# Altium schematic sheet RK3566_FLASH-SD_SHEET.SchDoc
size A4; SheetNumber: 11; SheetTotal: 23
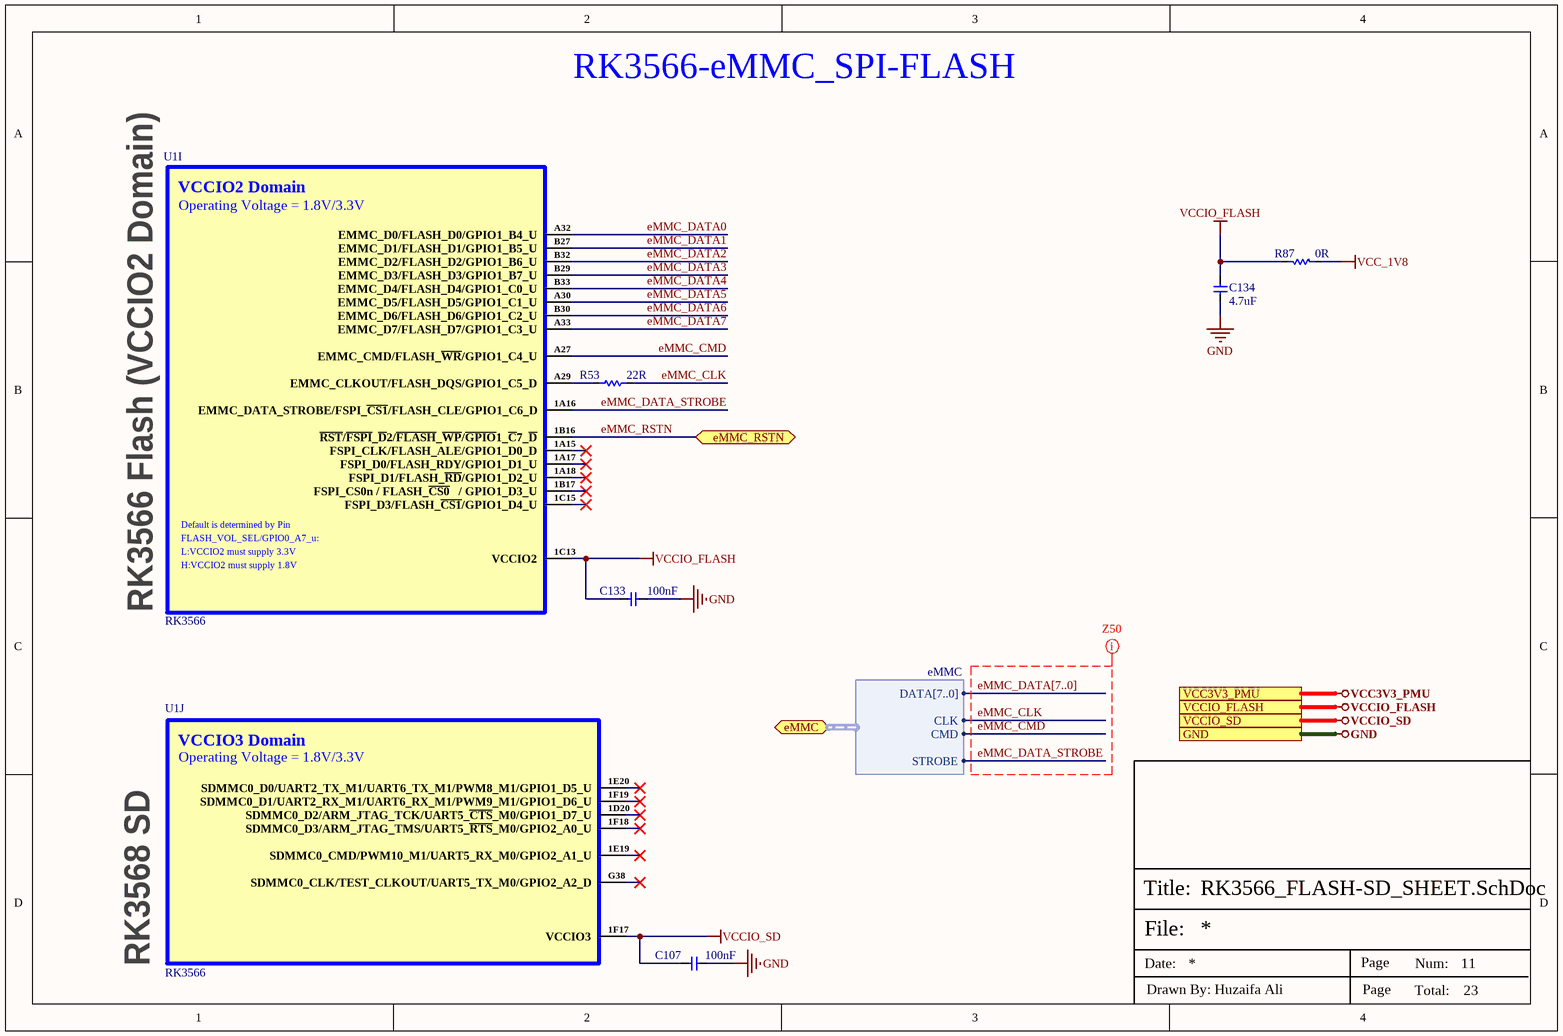
[diagram p0: RK3566_FLASH-SD_SHEET.SchDoc]

## Parts
C107  100nF  [CAP-0201]
C133  100nF  [CAP-0201]
C134  4.7uF  [Cap-0402]
R53  22R  [Res-0402]
R87  0R  [Res-0402]
U1  RK3566  [BGA-565(15.5x14.4)]  (parts I,J of 22)

## Ports
eMMC (bidir, harness eMMC, see eMMC_SPI-FLASH_SHEET[2D]), eMMC_RSTN (bidir, see eMMC_SPI-FLASH_SHEET[1D]), GND (see DRAM_LPDDR4_SHEET[6D], eMMC_SPI-FLASH_SHEET[1D], HDMI2.0_SHEET[3D], POWER_LDO_SHEET[3D], POWER_OTHER_SHEET[3C], POWER_PMIC_RK809_CODEC[3C], POWER_PMIC_RK809_DC DC[3D], POWER_PMIC_RK809_LDO[4C], POWER_PMIC_RK809_MGM[3D], RK3566_AUDIO_SHEET[3C], RK3566_DDR-PHY_SHEET[5D], RK3566_OSC_PMUIO_SHEET[5D], RK3566_POWER_SHEET[3D], RK3566_SARADC_GPIO[3D], RK3566_USB_PCIe_SHEET[3D], RK3566_VI_SHEET[3D], RK3566_VO_SHEET_1[3C], RK3566_VO_SHEET_2[4C], TYPE-C_INTERFACE_SHEET[3D], TYPE-C_TO_MIPI-CSI_SHEET[5D], USB2.0_SHEET[3D], WIFI-6_SHEET[3D]), VCC3V3_PMU (see POWER_OTHER_SHEET[3C], POWER_PMIC_RK809_LDO[4C], RK3566_OSC_PMUIO_SHEET[5D]), VCCIO_FLASH (see eMMC_SPI-FLASH_SHEET[1D]), VCCIO_SD (see POWER_PMIC_RK809_LDO[4C])

## Harnesses
eMMC: DATA[7..0], STROBE, CLK, CMD

## Nets
GND: C107.1 C133.1 C134.1 ; port GND
VCC3V3_PMU: port VCC3V3_PMU
VCC_1V8: R87.1
VCCIO_FLASH: C133.2 C134.2 R87.2 U1.1C13(VCCIO2) ; port VCCIO_FLASH
VCCIO_SD: C107.2 U1.1F17(VCCIO3) ; port VCCIO_SD
eMMC_CLK: R53.1 ; port eMMC.CLK
eMMC_CMD: U1.A27(EMMC_CMD/FLASH_~{WR}/GPIO1_C4_U) ; port eMMC.CMD
eMMC_DATA0: U1.A32(EMMC_D0/FLASH_D0/GPIO1_B4_U)
eMMC_DATA1: U1.B27(EMMC_D1/FLASH_D1/GPIO1_B5_U)
eMMC_DATA2: U1.B32(EMMC_D2/FLASH_D2/GPIO1_B6_U)
eMMC_DATA3: U1.B29(EMMC_D3/FLASH_D3/GPIO1_B7_U)
eMMC_DATA4: U1.B33(EMMC_D4/FLASH_D4/GPIO1_C0_U)
eMMC_DATA5: U1.A30(EMMC_D5/FLASH_D5/GPIO1_C1_U)
eMMC_DATA6: U1.B30(EMMC_D6/FLASH_D6/GPIO1_C2_U)
eMMC_DATA7: U1.A33(EMMC_D7/FLASH_D7/GPIO1_C3_U)
eMMC_DATA_STROBE: U1.1A16(EMMC_DATA_STROBE/FSPI_~{CS1}/FLASH_CLE/GPIO1_C6_D) ; port eMMC.STROBE
eMMC_RSTN: U1.1B16(~{RST}/~{FSPI}_~{D}2/~{FLASH}_~{WP}/~{GPIO}1_~{C}7_~{D}) ; port eMMC_RSTN
NetR53_2: R53.2 U1.A29(EMMC_CLKOUT/FLASH_DQS/GPIO1_C5_D)

Not connected (* = marked no-connect by the designer): U1 1A15(FSPI_CLK/FLASH_ALE/GPIO1_D0_D)* 1A17(FSPI_D0/FLASH_RDY/GPIO1_D1_U)* 1A18(FSPI_D1/FLASH_~{RD}/GPIO1_D2_U)* 1B17(FSPI_CS0n_/_FLASH_~{CS0}___/_GPIO1_D3_U)* 1C15(FSPI_D3/FLASH_~{CS1}/GPIO1_D4_U)* 1D20(SDMMC0_D2/ARM_JTAG_TCK/UART5_~{CTS}_M0/GPIO1_D7_U)* 1E19(SDMMC0_CMD/PWM10_M1/UART5_RX_M0/GPIO2_A1_U)* 1E20(SDMMC0_D0/UART2_TX_M1/UART6_TX_M1/PWM8_M1/GPIO1_D5_U)* 1F18(SDMMC0_D3/ARM_JTAG_TMS/UART5_~{RTS}_M0/GPIO2_A0_U)* 1F19(SDMMC0_D1/UART2_RX_M1/UART6_RX_M1/PWM9_M1/GPIO1_D6_U)* G38(SDMMC0_CLK/TEST_CLKOUT/UART5_TX_M0/GPIO2_A2_D)*

## Buses and harness runs
bus eMMC_DATA[7..0]

## Layout directives
net class 50OHM_eMMC: eMMC_CLK, eMMC_CMD, eMMC_DATA[7..0], eMMC_DATA_STROBE

## Notes on the sheet
- RK3566-eMMC_SPI-FLASH
- RK3566 Flash (VCCIO2 Domain)
- RK3568 SD
- File:
- Title:
- Date:
- Page
- Num:
- Total:
- Drawn By: Huzaifa Ali
- (in symbol RK3566, part I) VCCIO2 Domain; Operating Voltage = 1.8V/3.3V; Default is determined by Pin; FLASH_VOL_SEL/GPIO0_A7_u:; L:VCCIO2 must supply 3.3V; H:VCCIO2 must supply 1.8V
- (in symbol RK3566, part J) VCCIO3 Domain; Operating Voltage = 1.8V/3.3V

## Library data of the parts
C107 C133 = CC0201KRX5R6BB104: CAP CER 0.1UF 10V X5R 0201; Manufacturer: Yageo; Tolerance: 10%; Supplier 1: Mouser; Manufacturer Part Number: CC0201KRX5R6BB104; RoHS: Yes; Category: Ceramic Capacitors; Stock 1: 824403; Pricing 1: 1=0.10000, 10=0.02400, 50=0.02400, 100=0.01900, 1000=0.01100, 10000=0.00900 (USD); Mount: Surface Mount; Case/Package: 0201; Case Code (Imperial): 0201; Case Code (Metric): 0603; Weight: 6E-06oz; Min Operating Temperature: -55°C; Max Operating Temperature: 85°C; Capacitance: 100nF; Dielectric: X5R; Voltage Rating (DC): 10V; Packaging: Tape and Reel; Termination: SMD/SMT; Resistor Type: Ceramic; Voltage Rating: 10V; Series: CC; Construction: Flat; Length: 0.6mm; Width: 0.012inch; Height: 0.3mm; Thickness: 0.013inch; Depth: 0.3mm; Radiation Hardening: No; Lead Free: Lead Free; Halogen Free: Halogen Free; RoHS Compliant: Yes; ComponentLink1URL: https://datasheet.ciiva.com/11587/upy-gphc-x5r-4v-to-50v-12-11587190.pdf?src-supplier=Avnet; ComponentLink1Description: https://datasheet.ciiva.com/11587/upy-gphc-x5r-4v-to-50v-12-11587190.pdf?src-supplier=Avnet; Supplier Part Number 1: 603-CC201KRX5R6BB104; LCSC Part Number: C190183
C134 = CC0402KRX5R6BB475: CAP CER 4.7UF 10V X5R 0402; Manufacturer: Yageo; Tolerance: 10%; Supplier 1: Farnell; Manufacturer Part Number: CC0402KRX5R6BB475; RoHS: Yes; Category: Ceramic Capacitors; Stock 1: 20000; Pricing 1: 10000=0.02310, 50000=0.02100 (GBP); Mount: Surface Mount; Case/Package: 0402; Case Code (Imperial): 0402; Case Code (Metric): 1005; Min Operating Temperature: -55°C; Max Operating Temperature: 85°C; Packaging: Cut Tape; Capacitance: 4.7uF; Voltage Rating: 10V; RoHS Compliant: Yes; ComponentLink1URL: http://www.yageo.com/documents/recent/UPY-GPHC_X5R_4V-to-50V_25.pdf?src-supplier=Digi-Key; ComponentLink1Description: http://www.yageo.com/documents/recent/UPY-GPHC_X5R_4V-to-50V_25.pdf?src-supplier=Digi-Key; Supplier Part Number 1: 3871698; LCSC Part Number: C326586
R53 = RC0402FR-0722RL: RES 22 OHM 1% 1/16W 0402; Manufacturer: Yageo; Voltage Rating: 50V; Power Rating: 62.5mW; Temperature Coefficient: 100ppm/°C; Max Power Dissipation: 63mW; Item Type: Resistor; Supplier 1: Avnet; Manufacturer Part Number: RC0402FR-0722RL; RoHS: Yes; Category: Chip SMD Resistors; Stock 1: 1810000; Pricing 1: 10000=0.00085 (USD); Case/Package: 0402; Number of Pins: 2; Case Code (Imperial): 0402; Case Code (Metric): 1005; Size Code: 0402; Min Operating Temperature: -55°C; Max Operating Temperature: 155°C; Resistor Type: Thick Film; Voltage Rating (DC): 50V; Resistance: 22R; Tolerance: 1%; Packaging: Tape and Reel; Termination: SMD/SMT; Features: Moisture Resistant; Series: RC; Number of Terminations: 2; Resistance Tolerance: 1%; Technology: THICK FILM; Construction: Rectangular; Length: 1mm; Width: 0.5mm; Height: 0.32mm; Depth: 0.5mm; RoHS Compliant: Yes; Reach SVHC Compliant: Yes; Military Standard: Not; Lead Free: Lead Free; ComponentLink1URL: https://datasheet.ciiva.com/11819/0900766b80c66297-11819462.pdf?src-supplier=RSComponents; ComponentLink1Description: https://datasheet.ciiva.com/11819/0900766b80c66297-11819462.pdf?src-supplier=RSComponents; ComponentLink2URL: https://datasheet.ciiva.com/7849/1018594-7849912.pdf?src-supplier=Element14; ComponentLink2Description: https://datasheet.ciiva.com/7849/1018594-7849912.pdf?src-supplier=Element14; ComponentLink3URL: https://datasheet.ciiva.com/7849/1018594-7849911.pdf?src-supplier=Element14; ComponentLink3Description: https://datasheet.ciiva.com/7849/1018594-7849911.pdf?src-supplier=Element14; ComponentLink4URL: https://datasheet.ciiva.com/16930/pyu-rc0402-51-rohs-l-6-r-16930687.pdf?src-supplier=Future+Electronics; ComponentLink4Description: https://datasheet.ciiva.com/16930/pyu-rc0402-51-rohs-l-6-r-16930687.pdf?src-supplier=Future+Electronics; ComponentLink5URL: https://datasheet.ciiva.com/26829/getdatasheetpartid-554995-26829991.pdf?src-supplier=Verical; ComponentLink5Description: https://datasheet.ciiva.com/26829/getdatasheetpartid-554995-26829991.pdf?src-supplier=Verical; Supplier Part Number 1: RC0402FR-0722RL; LCSC Part Number: C114765
R87 = RC0402FR-070RL: RES 0 OHM JUMPER 1/16W 0402; Manufacturer: Yageo; Item Type: Resistors; Tolerance: 1%; Power Rating: 62.5mW; Voltage Rating: 50V; Temperature Coefficient: 200ppm/°C; Max Power Dissipation: 63mW; Manufacturer Part Number: RC0402FR-070RL; LCSC Part Number: C106231; Supplier 1: Mouser; RoHS: Yes; Stock 1: 8556842; Pricing 1: 1=0.10000, 10=0.01400, 50=0.01400, 100=0.00600, 1000=0.00300, 5000=0.00200, 10000=0.00100 (USD); Mount: Surface Mount; Case/Package: 0402; Contact Plating: Tin,Matte; Case Code (Imperial): 0402; Case Code (Metric): 1005; Size Code: 0402; Min Operating Temperature: -55°C; Max Operating Temperature: 155°C; Resistance: 0R; Resistor Type: Thick Film; Packaging: Tape and Reel; Termination: SMD/SMT; Features: Moisture Resistant; Series: RC; Number of Terminations: 2; Length: 1mm; Width: 0.5mm; Height: 0.35mm; Radiation Hardening: No; Lead Free: Lead Free; RoHS Compliant: Yes; ComponentLink1URL: https://datasheet.ciiva.com/8896/pyu-rc0402-51-rohs-l-6-8896149.pdf?src-supplier=Avnet; ComponentLink1Description: https://datasheet.ciiva.com/8896/pyu-rc0402-51-rohs-l-6-8896149.pdf?src-supplier=Avnet; ComponentLink2URL: https://datasheet.ciiva.com/16790/pyu-rc0402-51-rohs-l-6-r-16790444.pdf?src-supplier=Future+Electronics; ComponentLink2Description: https://datasheet.ciiva.com/16790/pyu-rc0402-51-rohs-l-6-r-16790444.pdf?src-supplier=Future+Electronics; Supplier Part Number 1: 603-RC0402FR-070RL
U1 = RK3566: BGA-565(15.5x14.4) Microcontrollers (MCU/MPU/SOC) ROHS; Manufacturer: Rockchip; Item Type: IC; Manufacturer Part Number: RK3566; Package: BGA-565(15.5x14.4); LCSC Part Number: C2943786; ComponentLink1Description: LCSC; ComponentLink1URL: https://www.lcsc.com/product-detail/Microcontrollers-MCU-MPU-SOC_Rockchip-RK3566_C2943786.html